# Altium schematic sheet Connector Sheet.SchDoc
size A4; SheetNumber: 5; SheetTotal: 5
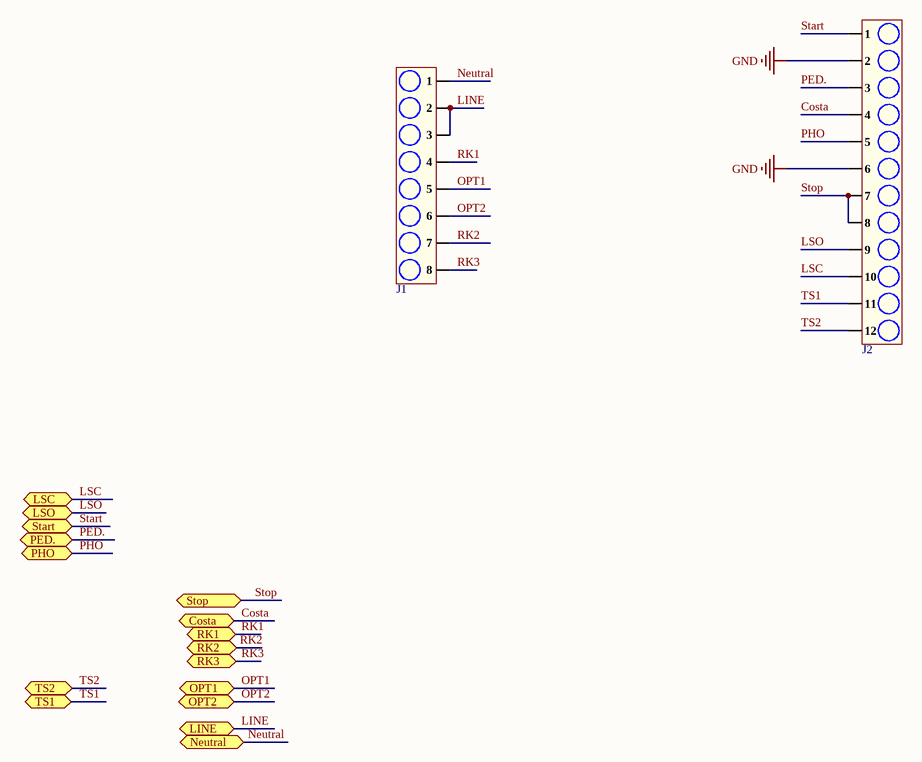
[diagram p0: Connector Sheet.SchDoc]

## Parts
J1  DB2EVC-5.08-8P-GN  [DB2EVC-5.08-8P-GN]  (value not drawn)
J2  DB2EVC-5.08-12P-GN  [DB2EVC-5.08-12P-GN]  (value not drawn)

## Ports
Costa (bidir, see Top Sheet[3B], Controller Sheet[1D], Peripheral Sheet[1D]), LINE (bidir, see Top Sheet[2A], Power Sheet[1D]), LSC (bidir, see Top Sheet[3B], Peripheral Sheet[1D]), LSO (bidir, see Top Sheet[3B], Peripheral Sheet[1D]), Neutral (bidir, see Top Sheet[2B], Power Sheet[1D]), OPT1 (bidir, see Top Sheet[2B], Power Sheet[1D]), OPT2 (bidir, see Top Sheet[2B], Power Sheet[1D]), PED. (bidir, see Top Sheet[3B], Peripheral Sheet[1D]), PHO (bidir, see Top Sheet[3B], Peripheral Sheet[1D]), RK1 (bidir, see Top Sheet[2B], Power Sheet[1D]), RK2 (bidir, see Top Sheet[2B], Power Sheet[1D]), RK3 (bidir, see Top Sheet[2B], Power Sheet[1D]), Start (bidir, see Top Sheet[3A], Peripheral Sheet[1D]), Stop (bidir, see Top Sheet[3B], Peripheral Sheet[1D]), TS1 (bidir, see Top Sheet[2B], Power Sheet[1D]), TS2 (bidir, see Top Sheet[2B], Power Sheet[1D])

## Nets
GND: J2.2 J2.6
Costa: J2.4 ; port Costa
LINE: J1.2 J1.3 ; port LINE
LSC: J2.10 ; port LSC
LSO: J2.9 ; port LSO
Neutral: J1.1 ; port Neutral
OPT1: J1.5 ; port OPT1
OPT2: J1.6 ; port OPT2
PED.: J2.3 ; port PED.
PHO: J2.5 ; port PHO
RK1: J1.4 ; port RK1
RK2: J1.7 ; port RK2
RK3: J1.8 ; port RK3
Start: J2.1 ; port Start
Stop: J2.7 J2.8 ; port Stop
TS1: J2.11 ; port TS1
TS2: J2.12 ; port TS2

## Notes on the sheet
- File:
- Title:
- Date:
- Page
- Num:
- Total:
- Drawn By: Huzaifa Ali

## Library data of the parts
J1 = DB2EVC-5.08-8P-GN: 320V 20A 8 Straight pin -40℃~+105℃ 1 5.08mm 1x8P Green Board Edge/Receptacle-Close Plugin,P=5.08mm Pluggable System Terminal Block ROHS; Manufacturer: DIBO; Manufacturer Part Number: DB2EVC-5.08-8P-GN; Package: Plugin,P=5.08mm; LCSC Part Number: C395784; Item Type: Terminal Block; ComponentLink1Description: LCSC; ComponentLink1URL: https://www.lcsc.com/product-detail/Pluggable-System-Terminal-Block_DIBO-DB2EVC-5-08-8P-GN_C395784.html
J2 = DB2EVC-5.08-12P-GN: 320V 20A 12 Straight pin -40℃~+105℃ 1 5.08mm 1x12P Green Board Edge/Receptacle-Close Plugin,P=5.08mm Pluggable System Terminal Block ROHS; Manufacturer: DIBO; Manufacturer Part Number: DB2EVC-5.08-12P-GN; Package: Plugin,P=5.08mm; LCSC Part Number: C395823; Item Type: Terminal Block; ComponentLink1Description: LCSC; ComponentLink1URL: https://www.lcsc.com/product-detail/Pluggable-System-Terminal-Block_DIBO-DB2EVC-5-08-12P-GN_C395823.html